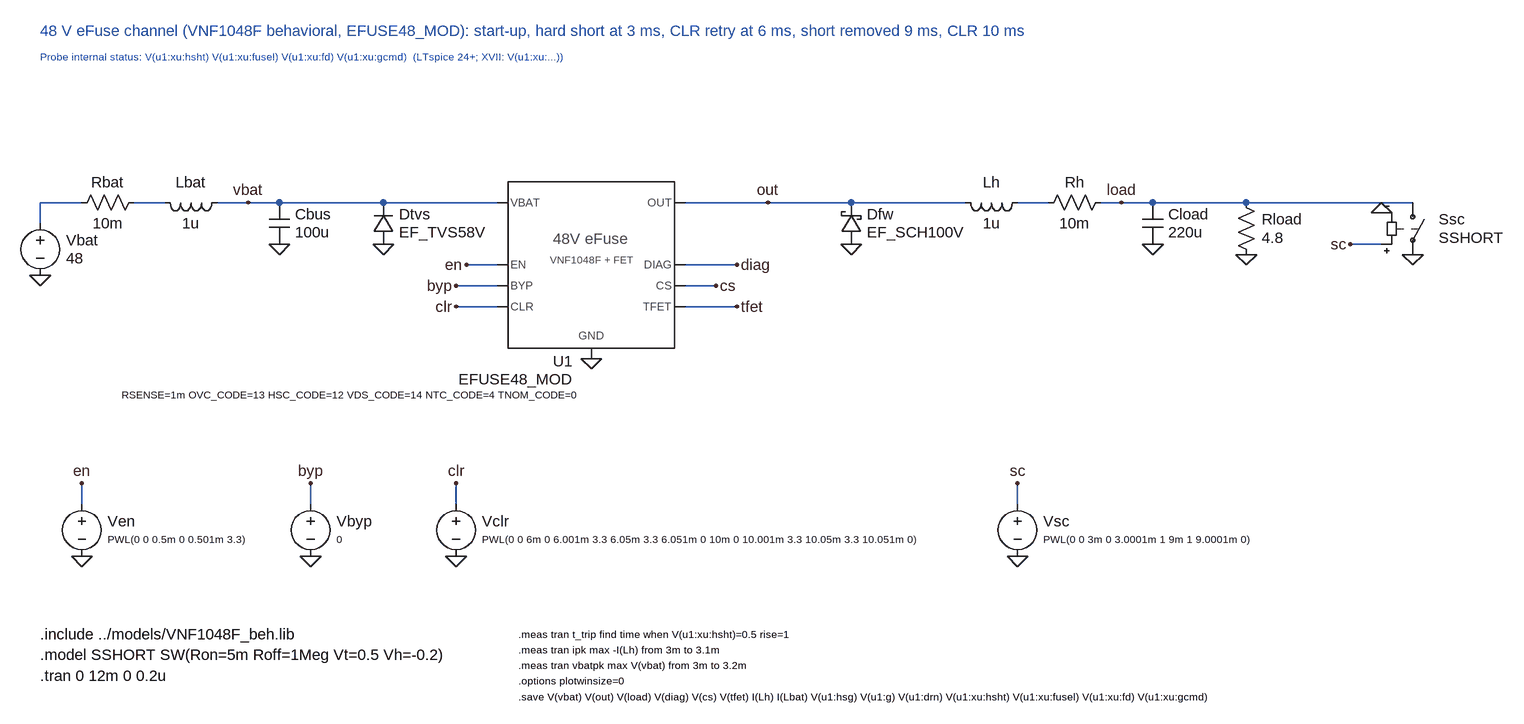
[diagram p0: schematic demo_efuse48_module.asc]
demo_efuse48_module.asc, the LTspice schematic file:
Version 4
SHEET 1 2400 1000
SYMBOL voltage 32 240 R0
WINDOW 0 40 42 Left 2
WINDOW 3 40 70 Left 2
SYMATTR InstName Vbat
SYMATTR Value 48
FLAG 32 336 0
SYMBOL res 192 208 R90
WINDOW 0 0 56 VBottom 2
WINDOW 3 32 56 VTop 2
SYMATTR InstName Rbat
SYMATTR Value 10m
SYMBOL ind 320 208 R90
WINDOW 0 0 56 VBottom 2
WINDOW 3 32 56 VTop 2
SYMATTR InstName Lbat
SYMATTR Value 1u
SYMBOL cap 384 224 R0
WINDOW 0 40 18 Left 2
WINDOW 3 40 46 Left 2
SYMATTR InstName Cbus
SYMATTR Value 100u
SYMATTR SpiceLine Rser=30m
FLAG 400 288 0
SYMBOL diode 576 288 R180
WINDOW 0 -8 46 Right 2
WINDOW 3 -8 18 Right 2
SYMATTR InstName Dtvs
SYMATTR Value EF_TVS58V
FLAG 560 288 0
SYMBOL EFUSE48_MOD 880 320 R0
SYMATTR InstName U1
SYMATTR SpiceLine RSENSE=1m OVC_CODE=13 HSC_CODE=12 VDS_CODE=14 NTC_CODE=4 TNOM_CODE=0
WIRE 32 256 32 224
WIRE 32 224 96 224
WIRE 176 224 224 224
WIRE 304 224 352 224
WIRE 352 224 400 224
FLAG 352 224 vbat
WIRE 400 224 560 224
WIRE 560 224 736 224
FLAG 880 464 0
SYMBOL schottky 1296 288 R180
WINDOW 0 -8 46 Right 2
WINDOW 3 -8 18 Right 2
SYMATTR InstName Dfw
SYMATTR Value EF_SCH100V
FLAG 1280 288 0
SYMBOL ind 1552 208 R90
WINDOW 0 0 56 VBottom 2
WINDOW 3 32 56 VTop 2
SYMATTR InstName Lh
SYMATTR Value 1u
SYMBOL res 1680 208 R90
WINDOW 0 0 56 VBottom 2
WINDOW 3 32 56 VTop 2
SYMATTR InstName Rh
SYMATTR Value 10m
SYMBOL cap 1728 224 R0
WINDOW 0 40 18 Left 2
WINDOW 3 40 46 Left 2
SYMATTR InstName Cload
SYMATTR Value 220u
SYMATTR SpiceLine Rser=20m
FLAG 1744 288 0
SYMBOL res 1872 208 R0
WINDOW 0 40 42 Left 2
WINDOW 3 40 70 Left 2
SYMATTR InstName Rload
SYMATTR Value 4.8
FLAG 1888 304 0
SYMBOL sw 2144 208 R0
WINDOW 0 40 42 Left 2
WINDOW 3 40 70 Left 2
SYMATTR InstName Ssc
SYMATTR Value SSHORT
FLAG 2144 304 0
FLAG 2096 240 0
WIRE 2096 288 2048 288
FLAG 2048 288 sc
WIRE 1024 224 1152 224
WIRE 1152 224 1280 224
FLAG 1152 224 out
WIRE 1280 224 1456 224
WIRE 1536 224 1584 224
WIRE 1664 224 1696 224
WIRE 1696 224 1744 224
FLAG 1696 224 load
WIRE 1744 224 1888 224
WIRE 1888 224 2144 224
WIRE 736 320 688 320
FLAG 688 320 en
WIRE 736 352 672 352
FLAG 672 352 byp
WIRE 736 384 672 384
FLAG 672 384 clr
WIRE 1024 320 1104 320
FLAG 1104 320 diag
WIRE 1024 352 1072 352
FLAG 1072 352 cs
WIRE 1024 384 1104 384
FLAG 1104 384 tfet
SYMBOL voltage 96 672 R0
WINDOW 0 40 42 Left 2
WINDOW 3 40 70 Left 1
SYMATTR InstName Ven
SYMATTR Value PWL(0 0 0.5m 0 0.501m 3.3)
WIRE 96 688 96 656
FLAG 96 656 en
FLAG 96 768 0
SYMBOL voltage 448 672 R0
WINDOW 0 40 42 Left 2
WINDOW 3 40 70 Left 1
SYMATTR InstName Vbyp
SYMATTR Value 0
WIRE 448 688 448 656
FLAG 448 656 byp
FLAG 448 768 0
SYMBOL voltage 672 672 R0
WINDOW 0 40 42 Left 2
WINDOW 3 40 70 Left 1
SYMATTR InstName Vclr
SYMATTR Value PWL(0 0 6m 0 6.001m 3.3 6.05m 3.3 6.051m 0 10m 0 10.001m 3.3 10.05m 3.3 10.051m 0)
WIRE 672 688 672 656
FLAG 672 656 clr
FLAG 672 768 0
SYMBOL voltage 1536 672 R0
WINDOW 0 40 42 Left 2
WINDOW 3 40 70 Left 1
SYMATTR InstName Vsc
SYMATTR Value PWL(0 0 3m 0 3.0001m 1 9m 1 9.0001m 0)
WIRE 1536 688 1536 656
FLAG 1536 656 sc
FLAG 1536 768 0
TEXT 32 -40 Left 2 ;48 V eFuse channel (VNF1048F behavioral, EFUSE48_MOD): start-up, hard short at 3 ms, CLR retry at 6 ms, short removed 9 ms, CLR 10 ms
TEXT 32 0 Left 1 ;Probe internal status: V(u1:xu:hsht) V(u1:xu:fusel) V(u1:xu:fd) V(u1:xu:gcmd)  (LTspice 24+; XVII: V(u1:xu:...))
TEXT 32 888 Left 2 !.include ../models/VNF1048F_beh.lib
TEXT 32 920 Left 2 !.model SSHORT SW(Ron=5m Roff=1Meg Vt=0.5 Vh=-0.2)
TEXT 32 952 Left 2 !.tran 0 12m 0 0.2u
TEXT 768 888 Left 1 !.meas tran t_trip find time when V(u1:xu:hsht)=0.5 rise=1
TEXT 768 912 Left 1 !.meas tran ipk max -I(Lh) from 3m to 3.1m
TEXT 768 936 Left 1 !.meas tran vbatpk max V(vbat) from 3m to 3.2m
TEXT 768 960 Left 1 !.options plotwinsize=0
TEXT 768 984 Left 1 !.save V(vbat) V(out) V(load) V(diag) V(cs) V(tfet) I(Lh) I(Lbat) V(u1:hsg) V(u1:g) V(u1:drn) V(u1:xu:hsht) V(u1:xu:fusel) V(u1:xu:fd) V(u1:xu:gcmd)

The netlist it stands for:
* demo_efuse48_module.asc
Vbat N001 0 48
Rbat N002 N001 10m
Lbat vbat N002 1u
Cbus vbat 0 100u Rser=30m
Dtvs 0 vbat EF_TVS58V
XU1 vbat out 0 en byp clr diag cs tfet EFUSE48_MOD RSENSE=1m OVC_CODE=13 HSC_CODE=12 VDS_CODE=14 NTC_CODE=4 TNOM_CODE=0  ; pins VBAT OUT GND EN BYP CLR DIAG CS TFET
Dfw 0 out EF_SCH100V
Lh N003 out 1u
Rh load N003 10m
Cload load 0 220u Rser=20m
Rload load 0 4.8
Ssc load 0 sc 0 SSHORT
Ven en 0 PWL(0 0 0.5m 0 0.501m 3.3)
Vbyp byp 0 0
Vclr clr 0 PWL(0 0 6m 0 6.001m 3.3 6.05m 3.3 6.051m 0 10m 0 10.001m 3.3 10.05m 3.3 10.051m 0)
Vsc sc 0 PWL(0 0 3m 0 3.0001m 1 9m 1 9.0001m 0)
.model D D
.lib standard.dio
* 48 V eFuse channel (VNF1048F behavioral, EFUSE48_MOD): start-up, hard short at 3 ms, CLR retry at 6 ms, short removed 9 ms, CLR 10 ms
* Probe internal status: V(u1:xu:hsht) V(u1:xu:fusel) V(u1:xu:fd) V(u1:xu:gcmd)  (LTspice 24+; XVII: V(u1:xu:...))
.include ../models/VNF1048F_beh.lib
.model SSHORT SW(Ron=5m Roff=1Meg Vt=0.5 Vh=-0.2)
.tran 0 12m 0 0.2u
.meas tran t_trip find time when V(u1:xu:hsht)=0.5 rise=1
.meas tran ipk max -I(Lh) from 3m to 3.1m
.meas tran vbatpk max V(vbat) from 3m to 3.2m
.options plotwinsize=0
.save V(vbat) V(out) V(load) V(diag) V(cs) V(tfet) I(Lh) I(Lbat) V(u1:hsg) V(u1:g) V(u1:drn) V(u1:xu:hsht) V(u1:xu:fusel) V(u1:xu:fd) V(u1:xu:gcmd)
.backanno
.end